# Altium project EMG-Arm_ELC-v1.0.PrjPcb (part 1 of 9)
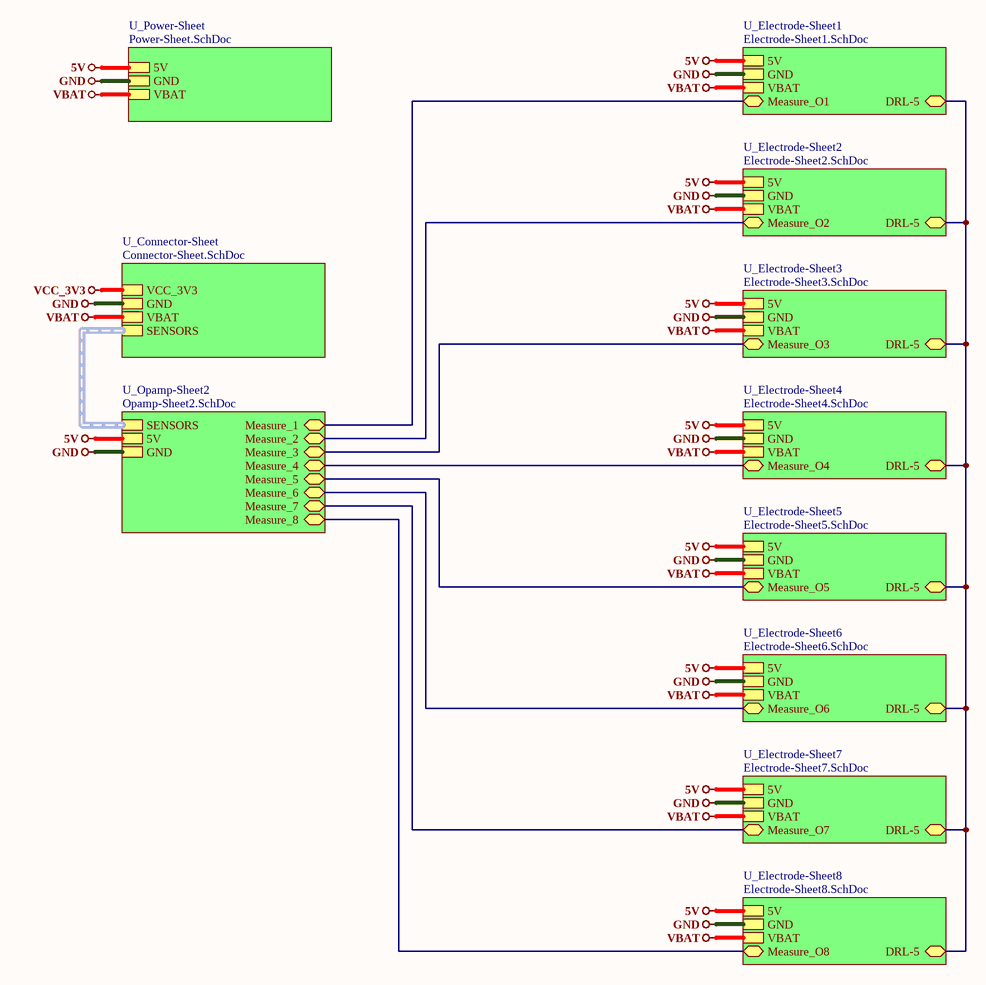
[diagram p0: Top-Sheet.SchDoc]
12 sheets, 303 parts. Net scope: hierarchical (ports join the sheet entries above them; power ports are global).
Board file: EMG-Arm-ELEC-V1.0.PcbDoc
Sheets:
  Top-Sheet.SchDoc
    U_Power-Sheet = Power-Sheet.SchDoc
    U_Opamp-Sheet2 = Opamp-Sheet2.SchDoc
    U_Connector-Sheet = Connector-Sheet.SchDoc
    U_Electrode-Sheet1 = Electrode-Sheet1.SchDoc
    U_Electrode-Sheet2 = Electrode-Sheet2.SchDoc
    U_Electrode-Sheet3 = Electrode-Sheet3.SchDoc
    U_Electrode-Sheet4 = Electrode-Sheet4.SchDoc
    U_Electrode-Sheet5 = Electrode-Sheet5.SchDoc
    U_Electrode-Sheet6 = Electrode-Sheet6.SchDoc
    U_Electrode-Sheet7 = Electrode-Sheet7.SchDoc
    U_Electrode-Sheet8 = Electrode-Sheet8.SchDoc

## Sheet Top-Sheet.SchDoc
size 420 x 297 mm; SheetNumber: 1; SheetTotal: 12

### Sub-sheets
U_Connector-Sheet = Connector-Sheet.SchDoc: SENSORS (harness SENSORS), VCC_3V3, GND, VBAT
U_Electrode-Sheet1 = Electrode-Sheet1.SchDoc: 5V, GND, VBAT, Measure_O1 (bidir), DRL-5 (bidir)
U_Electrode-Sheet2 = Electrode-Sheet2.SchDoc: 5V, GND, VBAT, Measure_O2 (bidir), DRL-5 (bidir)
U_Electrode-Sheet3 = Electrode-Sheet3.SchDoc: 5V, GND, VBAT, DRL-5 (bidir), Measure_O3 (bidir)
U_Electrode-Sheet4 = Electrode-Sheet4.SchDoc: 5V, GND, VBAT, Measure_O4 (bidir), DRL-5 (bidir)
U_Electrode-Sheet5 = Electrode-Sheet5.SchDoc: 5V, GND, VBAT, Measure_O5 (bidir), DRL-5 (bidir)
U_Electrode-Sheet6 = Electrode-Sheet6.SchDoc: 5V, GND, VBAT, DRL-5 (bidir), Measure_O6 (bidir)
U_Electrode-Sheet7 = Electrode-Sheet7.SchDoc: 5V, GND, VBAT, Measure_O7 (bidir), DRL-5 (bidir)
U_Electrode-Sheet8 = Electrode-Sheet8.SchDoc: 5V, GND, VBAT, Measure_O8 (bidir), DRL-5 (bidir)
U_Opamp-Sheet2 = Opamp-Sheet2.SchDoc: SENSORS (harness SENSORS), 5V, GND, Measure_1 (bidir), Measure_2 (bidir), Measure_3 (bidir), Measure_4 (bidir), Measure_5 (bidir), Measure_6 (bidir), Measure_7 (bidir), Measure_8 (bidir)
U_Power-Sheet = Power-Sheet.SchDoc: 5V, GND, VBAT

### Nets
5V: sheet U_Power-Sheet/5V, sheet U_Opamp-Sheet2/5V, sheet U_Electrode-Sheet1/5V, sheet U_Electrode-Sheet2/5V, sheet U_Electrode-Sheet3/5V, sheet U_Electrode-Sheet4/5V, sheet U_Electrode-Sheet5/5V, sheet U_Electrode-Sheet6/5V, sheet U_Electrode-Sheet7/5V, sheet U_Electrode-Sheet8/5V
GND: sheet U_Power-Sheet/GND, sheet U_Opamp-Sheet2/GND, sheet U_Connector-Sheet/GND, sheet U_Electrode-Sheet1/GND, sheet U_Electrode-Sheet2/GND, sheet U_Electrode-Sheet3/GND, sheet U_Electrode-Sheet4/GND, sheet U_Electrode-Sheet5/GND, sheet U_Electrode-Sheet6/GND, sheet U_Electrode-Sheet7/GND, sheet U_Electrode-Sheet8/GND
VBAT: sheet U_Power-Sheet/VBAT, sheet U_Connector-Sheet/VBAT, sheet U_Electrode-Sheet1/VBAT, sheet U_Electrode-Sheet2/VBAT, sheet U_Electrode-Sheet3/VBAT, sheet U_Electrode-Sheet4/VBAT, sheet U_Electrode-Sheet5/VBAT, sheet U_Electrode-Sheet6/VBAT, sheet U_Electrode-Sheet7/VBAT, sheet U_Electrode-Sheet8/VBAT
bpfOUT: sheet U_Opamp-Sheet2/Measure_1, sheet U_Electrode-Sheet1/Measure_O1
bpfOUT_2: sheet U_Opamp-Sheet2/Measure_2, sheet U_Electrode-Sheet2/Measure_O2
bpfOUT_3: sheet U_Opamp-Sheet2/Measure_3, sheet U_Electrode-Sheet3/Measure_O3
bpfOUT_4: sheet U_Opamp-Sheet2/Measure_4, sheet U_Electrode-Sheet4/Measure_O4
bpfOUT_5: sheet U_Opamp-Sheet2/Measure_5, sheet U_Electrode-Sheet5/Measure_O5
bpfOUT_6: sheet U_Opamp-Sheet2/Measure_6, sheet U_Electrode-Sheet6/Measure_O6
bpfOUT_7: sheet U_Opamp-Sheet2/Measure_7, sheet U_Electrode-Sheet7/Measure_O7
bpfOUT_8: sheet U_Opamp-Sheet2/Measure_8, sheet U_Electrode-Sheet8/Measure_O8
DRL-5: sheet U_Electrode-Sheet1/DRL-5, sheet U_Electrode-Sheet2/DRL-5, sheet U_Electrode-Sheet3/DRL-5, sheet U_Electrode-Sheet4/DRL-5, sheet U_Electrode-Sheet5/DRL-5, sheet U_Electrode-Sheet6/DRL-5, sheet U_Electrode-Sheet7/DRL-5, sheet U_Electrode-Sheet8/DRL-5

### Buses and harness runs
harness sheet U_Connector-Sheet/SENSORS = sheet U_Opamp-Sheet2/SENSORS

### Notes on the sheet
- File:
- Title:
- Date:
- Page
- Num:
- Total:
- Drawn By: Huzaifa Ali

## Sheet Power-Sheet.SchDoc
size A4; SheetNumber: 2; SheetTotal: 11
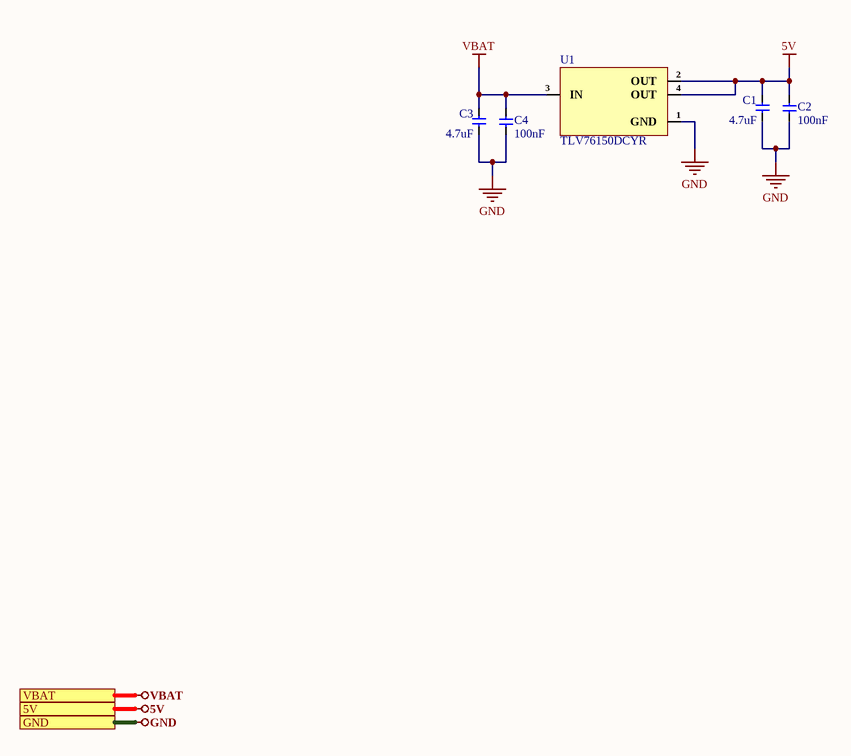
[diagram p1: Power-Sheet.SchDoc]

### Parts
C1  4.7uF  [Cap-0805]
C2  100nF  [cap-0402]
C3  4.7uF  [Cap-0805]
C4  100nF  [cap-0402]
U1  TLV76150DCYR  [SOT- 223]

### Ports
5V (see Top-Sheet[1A], Electrode-Sheet1[3D], Electrode-Sheet2[3D], Electrode-Sheet3[3D], Electrode-Sheet4[3D], Electrode-Sheet5[3D], Electrode-Sheet6[3D], Electrode-Sheet7[3D], Electrode-Sheet8[3D], Opamp-Sheet2[1D]), GND (see Top-Sheet[1A], Connector-Sheet[1D], Electrode-Sheet1[3D], Electrode-Sheet2[3D], Electrode-Sheet3[3D], Electrode-Sheet4[3D], Electrode-Sheet5[3D], Electrode-Sheet6[3D], Electrode-Sheet7[3D], Electrode-Sheet8[3D], Opamp-Sheet2[1D]), VBAT (see Top-Sheet[1A], Connector-Sheet[1D], Electrode-Sheet1[3D], Electrode-Sheet2[3D], Electrode-Sheet3[3D], Electrode-Sheet4[3D], Electrode-Sheet5[3D], Electrode-Sheet6[3D], Electrode-Sheet7[3D], Electrode-Sheet8[3D])

### Nets
5V: C1.1 C2.2 U1.2(OUT) U1.4(OUT) ; port 5V
GND: C1.2 C2.1 C3.2 C4.1 U1.1(GND) ; port GND
VBAT: C3.1 C4.2 U1.3(IN) ; port VBAT

### Notes on the sheet
- File:
- Title:
- Date:
- Page
- Num:
- Total:
- Drawn By: Huzaifa Ali

### Library data of the parts
C1 C3 = CL21B475KAFNNNE: CAP CER 4.7UF 25V X7R 0805; Manufacturer: Samsung; Item Type: Capacitors; Material: 4241ConductorMaterial; Tolerance: 10%; Supplier: Digikey; LCSC Part Number: C98195; Manufacturer Part Number: CL21B475KAFNNNE; RoHS: Yes; Stock: 74766; Pricing: 1=0.4, 10=0.246, 100=0.1664, 1000=0.1216 (USD); Mounting Technology: Surface Mount; Case/Package: 0805; Case Code (Metric): 2012; Case Code (Imperial): 0805; Min Operating Temperature: -55°C; Max Operating Temperature: 125°C; Packaging: Cut Tape; Value: 4.7uF; Voltage Rating: 25V; Voltage Rating (DC): 25V; Series: CL; Length: 0.079inch; Width: 0.049inch; Height: 1.45mm; Thickness: 0.053inch; Lead Free: Lead Free; RoHS Compliant: Yes; ComponentLink1URL: https://datasheet.ciiva.com/25711/cl21b475kafnnne-25711752.pdf?src-supplier=Digikey; ComponentLink1Description: https://datasheet.ciiva.com/25711/cl21b475kafnnne-25711752.pdf?src-supplier=Digikey
C2 C4 = C1005X7R1H104KT000F: CAP CER 0.1UF 50V X7R 0402; Manufacturer: TDK; Tolerance: 10%; Voltage: 25V; Item Type: Capacitor; Supplier 1: Avnet; Manufacturer Part Number: C1005X7R1H104KT000F; RoHS: No; Category: Ceramic Capacitors; Dielectric: X7R; Supplier Part Number 1: C1005X7R1H104KT000F; LCSC Part Number: C361198; ComponentLink1Description: LCSC; ComponentLink1URL: https://www.lcsc.com/product-detail/Multilayer-Ceramic-Capacitors-MLCC-SMD-SMT_TDK-C1005X7R1H104KT000F_C361198.html
U1 = TLV76150DCYR: IC REG LINEAR 5V 1A SOT-223-4; Manufacturer: Texas Instruments; Supplier: Mouser; LCSC Part Number: C5845194; Manufacturer Part Number: TLV76150DCYR; RoHS: No; Item Type: IC; Stock: 32246; Pricing: 1=0.5, 10=0.314, 50=0.314, 100=0.253, 1000=0.231, 10000=0.167 (USD)

## Sheet Opamp-Sheet2.SchDoc
size A4; DocumentNumber: 2; SheetNumber: 11; SheetTotal: 12
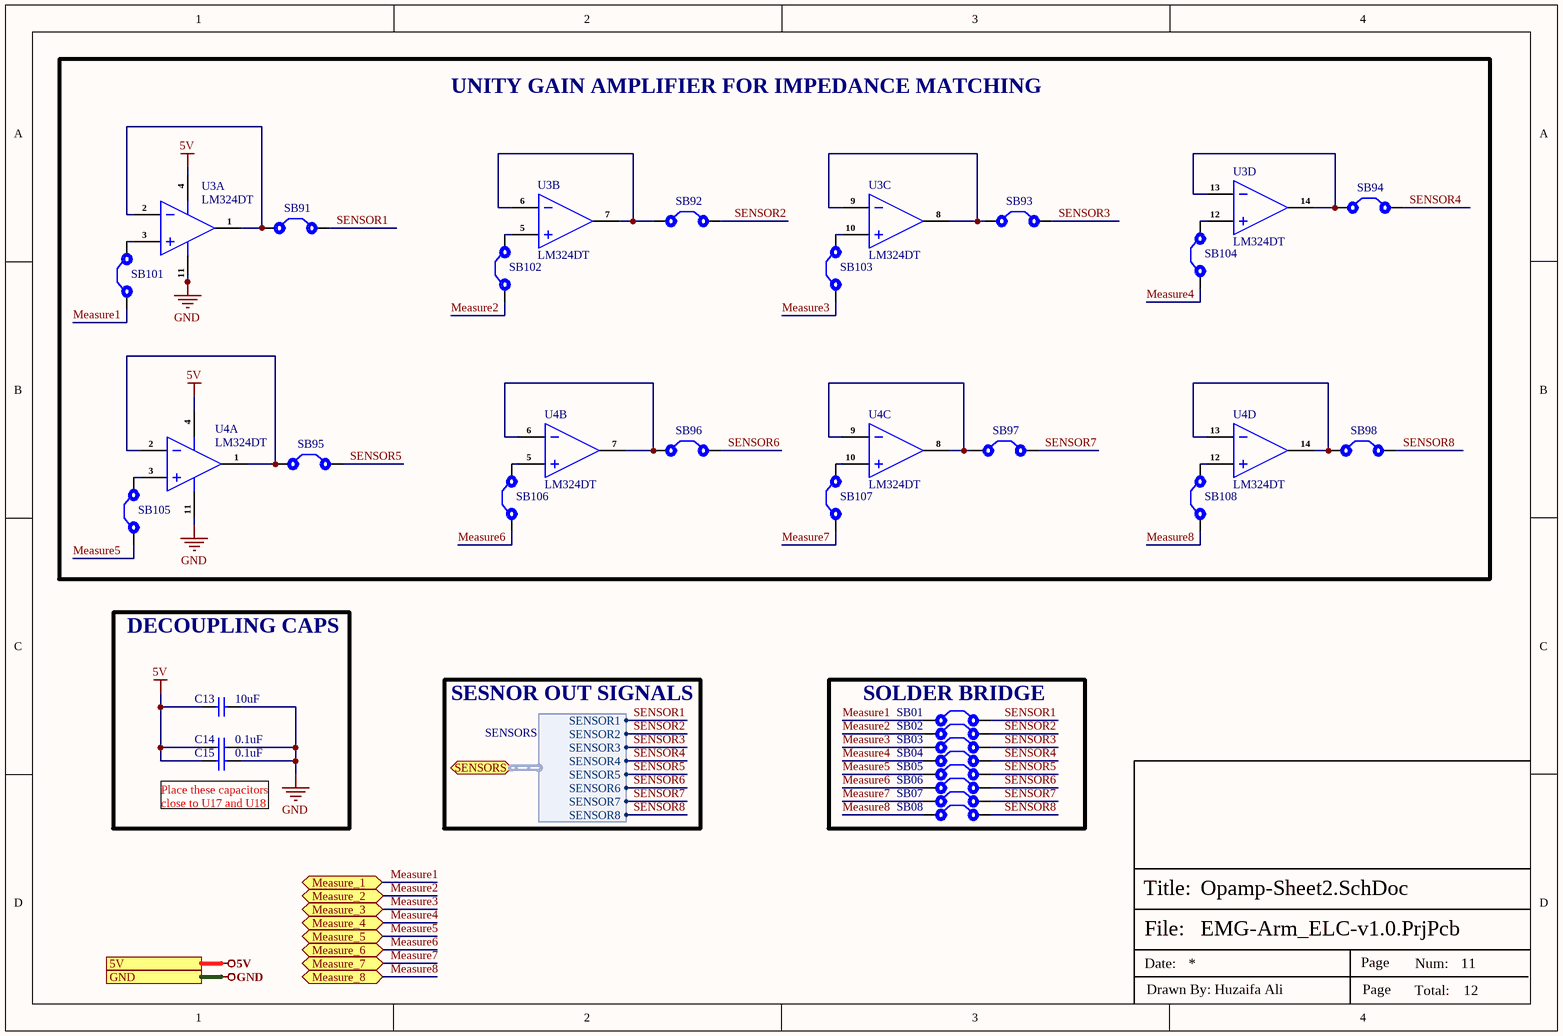
[diagram p2: Opamp-Sheet2.SchDoc]

### Parts
C13  10uF  [Cap-0603]
C14  0.1uF  [Cap-0402]
C15  0.1uF  [Cap-0402]
SB01  Solder Bridge 0402  [Solder Bridge 0402]  (value not drawn)  (no BOM)
SB02  Solder Bridge 0402  [Solder Bridge 0402]  (value not drawn)  (no BOM)
SB03  Solder Bridge 0402  [Solder Bridge 0402]  (value not drawn)  (no BOM)
SB04  Solder Bridge 0402  [Solder Bridge 0402]  (value not drawn)  (no BOM)
SB05  Solder Bridge 0402  [Solder Bridge 0402]  (value not drawn)  (no BOM)
SB06  Solder Bridge 0402  [Solder Bridge 0402]  (value not drawn)  (no BOM)
SB07  Solder Bridge 0402  [Solder Bridge 0402]  (value not drawn)  (no BOM)
SB08  Solder Bridge 0402  [Solder Bridge 0402]  (value not drawn)  (no BOM)
SB91  Solder Bridge 0402  [Solder Bridge 0402]  (value not drawn)  (no BOM)
SB92  Solder Bridge 0402  [Solder Bridge 0402]  (value not drawn)  (no BOM)
SB93  Solder Bridge 0402  [Solder Bridge 0402]  (value not drawn)  (no BOM)
SB94  Solder Bridge 0402  [Solder Bridge 0402]  (value not drawn)  (no BOM)
SB95  Solder Bridge 0402  [Solder Bridge 0402]  (value not drawn)  (no BOM)
SB96  Solder Bridge 0402  [Solder Bridge 0402]  (value not drawn)  (no BOM)
SB97  Solder Bridge 0402  [Solder Bridge 0402]  (value not drawn)  (no BOM)
SB98  Solder Bridge 0402  [Solder Bridge 0402]  (value not drawn)  (no BOM)
SB101  Solder Bridge 0402  [Solder Bridge 0402]  (value not drawn)  (no BOM)
SB102  Solder Bridge 0402  [Solder Bridge 0402]  (value not drawn)  (no BOM)
SB103  Solder Bridge 0402  [Solder Bridge 0402]  (value not drawn)  (no BOM)
SB104  Solder Bridge 0402  [Solder Bridge 0402]  (value not drawn)  (no BOM)
SB105  Solder Bridge 0402  [Solder Bridge 0402]  (value not drawn)  (no BOM)
SB106  Solder Bridge 0402  [Solder Bridge 0402]  (value not drawn)  (no BOM)
SB107  Solder Bridge 0402  [Solder Bridge 0402]  (value not drawn)  (no BOM)
SB108  Solder Bridge 0402  [Solder Bridge 0402]  (value not drawn)  (no BOM)
U3  LM324DT  [14-SO]  (parts A,B,C,D of 4)
U4  LM324DT  [14-SO]  (parts A,B,C,D of 4)

### Blocks framed on the sheet
UNITY GAIN AMPLIFIER FOR IMPEDANCE MATCHING: SB91-SB98 SB101-SB108 U3 U4
DECOUPLING CAPS: C13-C15
SOLDER BRIDGE: SB01 SB02 SB03 SB04 SB05 SB06 SB07 SB08

### Ports
5V (see Top-Sheet[2B], Electrode-Sheet1[3D], Electrode-Sheet2[3D], Electrode-Sheet3[3D], Electrode-Sheet4[3D], Electrode-Sheet5[3D], Electrode-Sheet6[3D], Electrode-Sheet7[3D], Electrode-Sheet8[3D], Power-Sheet[1D]), GND (see Top-Sheet[2B], Connector-Sheet[1D], Electrode-Sheet1[3D], Electrode-Sheet2[3D], Electrode-Sheet3[3D], Electrode-Sheet4[3D], Electrode-Sheet5[3D], Electrode-Sheet6[3D], Electrode-Sheet7[3D], Electrode-Sheet8[3D], Power-Sheet[1D]), Measure_1 (bidir, see Top-Sheet[2B]), Measure_2 (bidir, see Top-Sheet[2B]), Measure_3 (bidir, see Top-Sheet[2B]), Measure_4 (bidir, see Top-Sheet[2B]), Measure_5 (bidir, see Top-Sheet[2C]), Measure_6 (bidir, see Top-Sheet[2C]), Measure_7 (bidir, see Top-Sheet[2C]), Measure_8 (bidir, see Top-Sheet[2C]), SENSORS (bidir, harness SENSORS, see Top-Sheet[2B], Connector-Sheet[3A])

### Harnesses
SENSORS: SENSOR1, SENSOR2, SENSOR3, SENSOR4, SENSOR5, SENSOR6, SENSOR7, SENSOR8

### Nets
5V: C13.1 C14.1 C15.1 U3.4(VCC+) U4.4(VCC+) ; port 5V
GND: C13.2 C14.2 C15.2 U3.11(VCC-) U4.11(VCC-) ; port GND
Measure1: SB01.1 SB101.1 ; port Measure_1  [project net bpfOUT]
Measure2: SB02.1 SB102.1 ; port Measure_2  [project net bpfOUT_2]
Measure3: SB03.1 SB103.1 ; port Measure_3  [project net bpfOUT_3]
Measure4: SB04.1 SB104.1 ; port Measure_4  [project net bpfOUT_4]
Measure5: SB05.1 SB105.1 ; port Measure_5  [project net bpfOUT_5]
Measure6: SB06.1 SB106.1 ; port Measure_6  [project net bpfOUT_6]
Measure7: SB07.1 SB107.1 ; port Measure_7  [project net bpfOUT_7]
Measure8: SB08.1 SB108.1 ; port Measure_8  [project net bpfOUT_8]
SENSOR1: SB01.2 SB91.2 ; port SENSORS.SENSOR1
SENSOR2: SB02.2 SB92.2 ; port SENSORS.SENSOR2
SENSOR3: SB03.2 SB93.2 ; port SENSORS.SENSOR3
SENSOR4: SB04.2 SB94.2 ; port SENSORS.SENSOR4
SENSOR5: SB05.2 SB95.2 ; port SENSORS.SENSOR5
SENSOR6: SB06.2 SB96.2 ; port SENSORS.SENSOR6
SENSOR7: SB07.2 SB97.2 ; port SENSORS.SENSOR7
SENSOR8: SB08.2 SB98.2 ; port SENSORS.SENSOR8
NetSB91_1: SB91.1 U3.1(1OUT) U3.2(IN-)
NetSB92_1: SB92.1 U3.6(2IN-) U3.7(2OUT)
NetSB93_1: SB93.1 U3.8(3OUT) U3.9(3IN-)
NetSB94_1: SB94.1 U3.13(4IN-) U3.14(4OUT)
NetSB95_1: SB95.1 U4.1(1OUT) U4.2(IN-)
NetSB96_1: SB96.1 U4.6(2IN-) U4.7(2OUT)
NetSB97_1: SB97.1 U4.8(3OUT) U4.9(3IN-)
NetSB98_1: SB98.1 U4.13(4IN-) U4.14(4OUT)
NetSB101_2: SB101.2 U3.3(IN+)
NetSB102_2: SB102.2 U3.5(2IN+)
NetSB103_2: SB103.2 U3.10(3IN+)
NetSB104_2: SB104.2 U3.12(4IN+)
NetSB105_2: SB105.2 U4.3(IN+)
NetSB106_2: SB106.2 U4.5(2IN+)
NetSB107_2: SB107.2 U4.10(3IN+)
NetSB108_2: SB108.2 U4.12(4IN+)

### Notes on the sheet
- SESNOR OUT SIGNALS
- Place these capacitors close to U17 and U18
- File:
- Title:
- Date:
- Page
- Num:
- Total:
- Drawn By: Huzaifa Ali

### Library data of the parts
C13 = CL10A106MA8NRNC: CAP CER 10UF 25V X5R 0603; Manufacturer: Samsung; Tolerance: 20%; Supplier 1: Avnet; Manufacturer Part Number: CL10A106MA8NRNC; RoHS: Yes; Category: Ceramic Capacitors; Pricing 1: 4000=0.03753, 8000=0.03700, 16000=0.03595, 24000=0.03515, 32000=0.03383, 40000=0.03304, 400000=0.03225 (USD); Mount: Surface Mount; Case/Package: 0603; Case Code (Metric): 1608; Case Code (Imperial): 0603; Contact Plating: Tin; Min Operating Temperature: -55°C; Max Operating Temperature: 85°C; Package Quantity: 1; Packaging: Tape and Reel; Capacitance: 10uF; Voltage Rating: 25V; Dielectric: X5R; Termination: Wraparound; Series: CL; Construction: Flat; Length: 0.063inch; Width: 0.031inch; Thickness: 0.035inch; Lead Free: Lead Free; RoHS Compliant: Yes; ComponentLink1URL: https://datasheet.ciiva.com/25766/cl10a106ma8nrnc-25766562.pdf?src-supplier=Digi-Key; ComponentLink1Description: https://datasheet.ciiva.com/25766/cl10a106ma8nrnc-25766562.pdf?src-supplier=Digi-Key; Supplier Part Number 1: CL10A106MA8NRNC; LCSC Part Number: C96446
C14 C15 = GRM155R71H104ME14D: CAP CER 0.1UF 50V X7R 0402; Manufacturer: Murata; Tolerance: 20%; Capacitance: 100nF; Item Type: Capacitor; Supplier 1: Avnet; Manufacturer Part Number: GRM155R71H104ME14D; Stock 1: 100000; Pricing 1: 10000=0.00444, 20000=0.00420, 40000=0.00396, 60000=0.00372, 80000=0.00348, 100000=0.00324, 1000000=0.00300 (USD); Mount: Surface Mount; Case/Package: 0402; Min Operating Temperature: -55°C; Max Operating Temperature: 125°C; Packaging: Cut Tape; Voltage Rating: 50V; Length: 0.039inch; Width: 0.02inch; Thickness: 0.022inch; ComponentLink1URL: http://www.mouser.com/ds/2/281/c02e-2905.pdf?src-supplier=Mouser; ComponentLink1Description: http://www.mouser.com/ds/2/281/c02e-2905.pdf?src-supplier=Mouser; ComponentLink2URL: http://search.murata.co.jp/Ceramy/image/img/A01X/G101/ENG/GRM155R71H104ME14-01.pdf?src-supplier=Digi-Key; ComponentLink2Description: http://search.murata.co.jp/Ceramy/image/img/A01X/G101/ENG/GRM155R71H104ME14-01.pdf?src-supplier=Digi-Key; ComponentLink3URL: http://psearch.en.murata.com/capacitor/product/GRM155R71H104ME14%23.pdf?src-supplier=Avnet; ComponentLink3Description: http://psearch.en.murata.com/capacitor/product/GRM155R71H104ME14%23.pdf?src-supplier=Avnet; Supplier Part Number 1: GRM155R71H104ME14D; RoHS: Yes; Category: Ceramic Capacitors; RoHS Compliant: Yes; LCSC Part Number: C182412
SB01 SB02 SB03 SB04 SB05 SB06 SB07 SB08 SB91-SB98 SB101-SB108 = Solder Bridge 0402: Solder Bridge ON; Manufacturer Part Number: Solder Bridge 0402; Item Type: Solder Bridge
U3 U4 = LM324DT: IC OPAMP GP 1.3MHZ 14SO; Manufacturer: STMicroelectronics; Max Supply Voltage: 30V; Min Supply Voltage: 3V; Min Dual Supply Voltage: 1.5V; Max Dual Supply Voltage: 15V; Voltage Gain: 100dB; Slew Rate: 0.4V/µs; Common Mode Rejection Ratio: 70dB; Nominal Supply Current: 1.2mA; Input Offset Voltage (Vos): 7mV; Input Bias Current: 150nA; Number of Circuits: 4; Output Current per Channel: 40mA; Dual Supply Voltage: 12V; Supply Type: Single,Dual; Input Voltage Noise Density: 40nV/sqrt Hz; Max Power Dissipation: 400mW; Supplier 1: Arrow Electronics; Manufacturer Part Number: LM324DT; RoHS: Yes; Stock 1: 287500; Pricing 1: 2500=0.18900 (USD); Mount: Surface Mount; Case/Package: SO; Number of Pins: 14; Contact Plating: Tin,Matte; Weight: 0.009143oz; Min Operating Temperature: 0°C; Max Operating Temperature: 70°C; Gain Bandwidth Product: 1.3MHz; Packaging: Cut Tape; Package Quantity: 2500; Operating Supply Current: 1.2mA; Operating Supply Voltage: 15V; Number of Channels: 4; Output Current: 40mA; Number of Elements: 4; Series: LM324; Technology: BIPOLAR; Bandwidth: 1.3MHz; Number of Amplifiers: 4; Unity Gain Bandwidth Product: 1.3MHz; Width: 4mm; Height: 1.65mm; Radiation Hardening: No; RoHS Compliant: Yes; Lead Free: Lead Free; REACH SVHC: No SVHC; ComponentLink1URL: https://datasheet.ciiva.com/4758/cd00000457-103203-4758032.pdf?src-supplier=Mouser; ComponentLink1Description: https://datasheet.ciiva.com/4758/cd00000457-103203-4758032.pdf?src-supplier=Mouser; ComponentLink2URL: https://datasheet.ciiva.com/8008/1834360-8008827.pdf?src-supplier=Element14; ComponentLink2Description: https://datasheet.ciiva.com/8008/1834360-8008827.pdf?src-supplier=Element14; ComponentLink3URL: https://datasheet.ciiva.com/8008/1834360-8008490.pdf?src-supplier=Element14; ComponentLink3Description: https://datasheet.ciiva.com/8008/1834360-8008490.pdf?src-supplier=Element14; ComponentLink4URL: https://datasheet.ciiva.com/28630/1834360-28630538.pdf?src-supplier=Element14; ComponentLink4Description: https://datasheet.ciiva.com/28630/1834360-28630538.pdf?src-supplier=Element14; ComponentLink5URL: https://datasheet.ciiva.com/1795/cd00000457-1795560.pdf?src-supplier=Digi-Key; ComponentLink5Description: https://datasheet.ciiva.com/1795/cd00000457-1795560.pdf?src-supplier=Digi-Key; ComponentLink6URL: https://datasheet.ciiva.com/1795/cd00000457-1795559.pdf?src-supplier=Digi-Key; ComponentLink6Description: https://datasheet.ciiva.com/1795/cd00000457-1795559.pdf?src-supplier=Digi-Key; ComponentLink7URL: https://datasheet.ciiva.com/1795/cd00000457-1795561.pdf?src-supplier=Digi-Key; ComponentLink7Description: https://datasheet.ciiva.com/1795/cd00000457-1795561.pdf?src-supplier=Digi-Key; ComponentLink8URL: https://datasheet.ciiva.com/16375/cd00000457-16375528.pdf?src-supplier=Future+Electronics; ComponentLink8Description: https://datasheet.ciiva.com/16375/cd00000457-16375528.pdf?src-supplier=Future+Electronics; Supplier Part Number 1: LM324DT; LCSC Part Number: C71035; Item Type: IC

## Sheet Connector-Sheet.SchDoc
size A4; DocumentNumber: 3; SheetNumber: 12; SheetTotal: 12
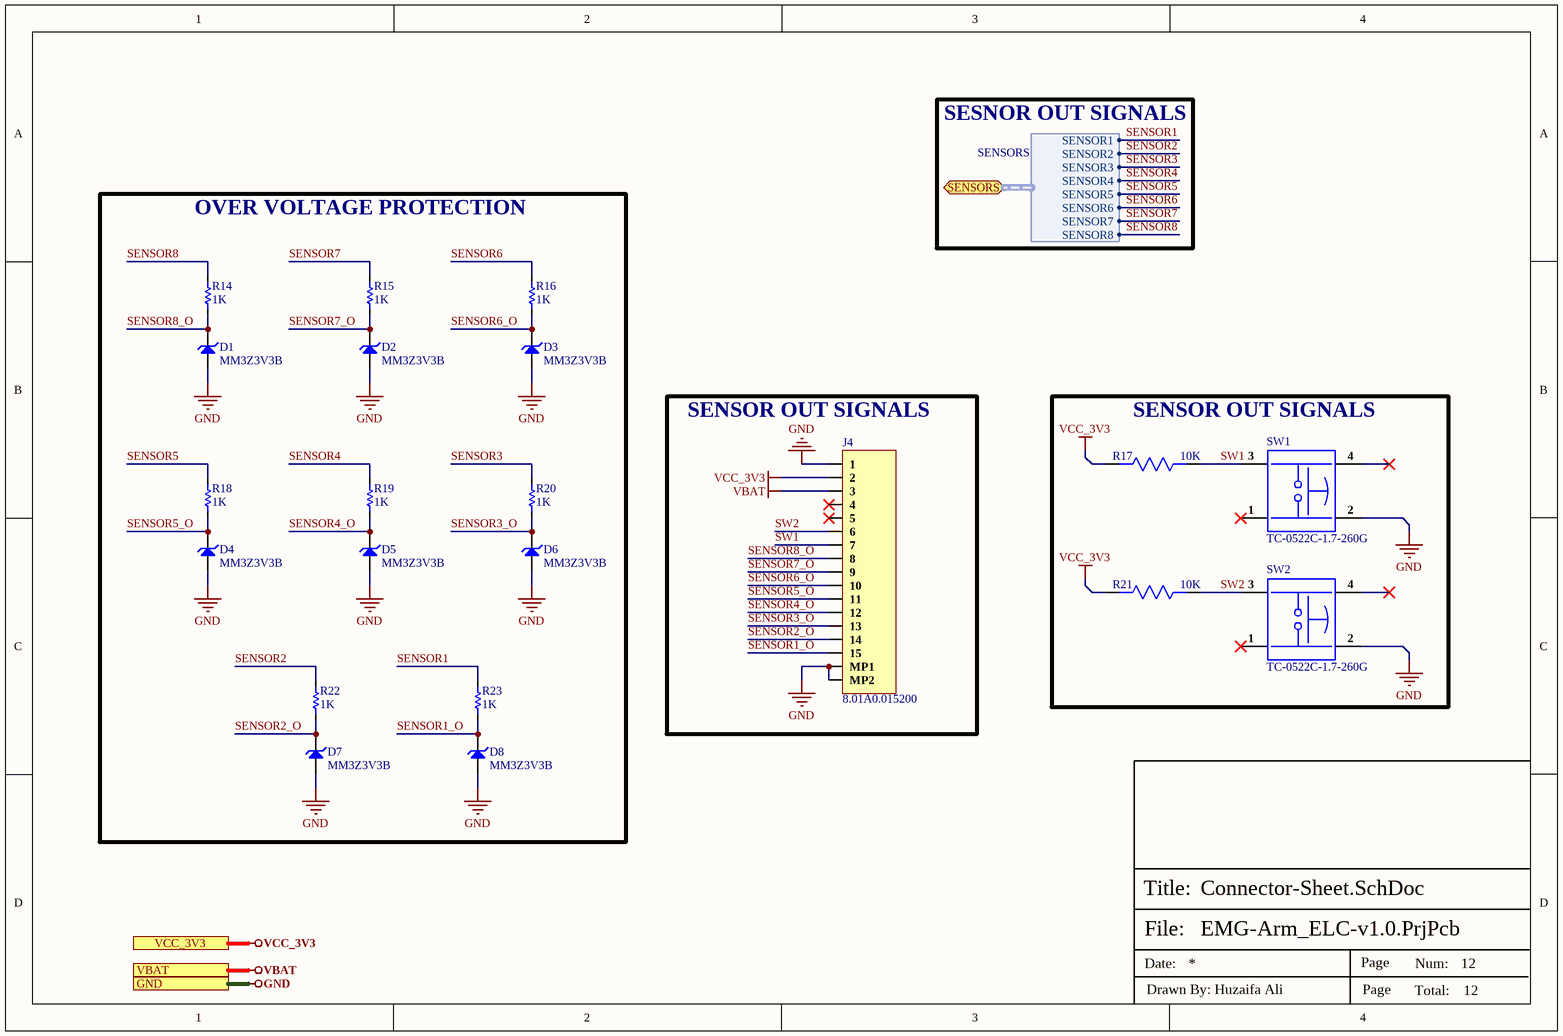
[diagram p3: Connector-Sheet.SchDoc]

### Parts
D1  MM3Z3V3B  [SOD323F]
D2  MM3Z3V3B  [SOD323F]
D3  MM3Z3V3B  [SOD323F]
D4  MM3Z3V3B  [SOD323F]
D5  MM3Z3V3B  [SOD323F]
D6  MM3Z3V3B  [SOD323F]
D7  MM3Z3V3B  [SOD323F]
D8  MM3Z3V3B  [SOD323F]
J4  8.01A0.015200  [8.01A0.015200]
R14  1K  [Res-0402]
R15  1K  [Res-0402]
R16  1K  [Res-0402]
R17  10K  [Res-0402]
R18  1K  [Res-0402]
R19  1K  [Res-0402]
R20  1K  [Res-0402]
R21  10K  [Res-0402]
R22  1K  [Res-0402]
R23  1K  [Res-0402]
SW1  TC-0522C-1.7-260G  [TC-0522C-1.7-260G_]
SW2  TC-0522C-1.7-260G  [TC-0522C-1.7-260G_]

### Blocks framed on the sheet
OVER VOLTAGE PROTECTION: D1-D8 R14-R16 R18-R20 R22 R23
SENSOR OUT SIGNALS: J4
SENSOR OUT SIGNALS: R17 R21 SW1 SW2

### Ports
GND (see Top-Sheet[2B], Electrode-Sheet1[3D], Electrode-Sheet2[3D], Electrode-Sheet3[3D], Electrode-Sheet4[3D], Electrode-Sheet5[3D], Electrode-Sheet6[3D], Electrode-Sheet7[3D], Electrode-Sheet8[3D], Opamp-Sheet2[1D], Power-Sheet[1D]), SENSORS (bidir, harness SENSORS, see Top-Sheet[2B], Opamp-Sheet2[2C]), VBAT (see Top-Sheet[2B], Electrode-Sheet1[3D], Electrode-Sheet2[3D], Electrode-Sheet3[3D], Electrode-Sheet4[3D], Electrode-Sheet5[3D], Electrode-Sheet6[3D], Electrode-Sheet7[3D], Electrode-Sheet8[3D], Power-Sheet[1D]), VCC_3V3 (see Top-Sheet[2B])

### Harnesses
SENSORS: SENSOR1, SENSOR2, SENSOR3, SENSOR4, SENSOR5, SENSOR6, SENSOR7, SENSOR8

### Nets
GND: D1.1(A) D2.1(A) D3.1(A) D4.1(A) D5.1(A) D6.1(A) D7.1(A) D8.1(A) J4.1 J4.MP1 J4.MP2 SW1.2 SW2.2 ; port GND
VBAT: J4.3 ; port VBAT
VCC_3V3: J4.2 R17.2 R21.2 ; port VCC_3V3
SENSOR1: R23.2 ; port SENSORS.SENSOR1
SENSOR1_O: D8.2(K) J4.15 R23.1
SENSOR2: R22.2 ; port SENSORS.SENSOR2
SENSOR2_O: D7.2(K) J4.14 R22.1
SENSOR3: R20.2 ; port SENSORS.SENSOR3
SENSOR3_O: D6.2(K) J4.13 R20.1
SENSOR4: R19.2 ; port SENSORS.SENSOR4
SENSOR4_O: D5.2(K) J4.12 R19.1
SENSOR5: R18.2 ; port SENSORS.SENSOR5
SENSOR5_O: D4.2(K) J4.11 R18.1
SENSOR6: R16.2 ; port SENSORS.SENSOR6
SENSOR6_O: D3.2(K) J4.10 R16.1
SENSOR7: R15.2 ; port SENSORS.SENSOR7
SENSOR7_O: D2.2(K) J4.9 R15.1
SENSOR8: R14.2 ; port SENSORS.SENSOR8
SENSOR8_O: D1.2(K) J4.8 R14.1
SW1: J4.7 R17.1 SW1.3
SW2: J4.6 R21.1 SW2.3

Not connected (* = marked no-connect by the designer): J4 4* 5*; SW1 1* 4*; SW2 1* 4*

### Notes on the sheet
- SESNOR OUT SIGNALS
- File:
- Title:
- Date:
- Page
- Num:
- Total:
- Drawn By: Huzaifa Ali

### Library data of the parts
D1-D8 = MM3Z3V3B: DIODE ZENER 3.3V 200MW SOD323F; Manufacturer: ON Semiconductor / Fairchild; Forward Voltage: 1V; Tolerance: 2%; Impedance: 89R; Max Reverse Leakage Current: 4.5uA; Test Current: 5mA; Element Configuration: Single; Supplier 1: Digi-Key; Manufacturer Part Number: MM3Z3V3B; Stock 1: 473644; Pricing 1: 1=0.22, 10=0.18, 100=0.0956, 500=0.06288, 1000=0.04276 (USD); Mount: Surface Mount; Number of Pins: 2; Weight: 0.0276g; Min Operating Temperature: -65°C; Max Operating Temperature: 150°C; Packaging: Tape and Reel; Package Quantity: 1; Max Power Dissipation: 200mW; Zener Voltage: 3.3V; Voltage Tolerance: 2%; Power Dissipation: 200mW; Working Voltage: 3.3V; Peak Reverse Current: 4.5uA; Length: 1.3mm; Height: 1mm; Width: 1.7mm; Radiation Hardening: No; REACH SVHC: No SVHC; Lead Free: Lead Free; ComponentLink1URL: http://www.onsemi.com/pub/Collateral/MM3Z9V1B-D.pdf?src-supplier=Digi-Key; ComponentLink1Description: http://www.onsemi.com/pub/Collateral/MM3Z9V1B-D.pdf?src-supplier=Digi-Key; ComponentLink2URL: http://www.mouser.com/ds/2/149/MM3Z3V3B-187166.pdf?src-supplier=Mouser; ComponentLink2Description: http://www.mouser.com/ds/2/149/MM3Z3V3B-187166.pdf?src-supplier=Mouser; ComponentLink3URL: https://www.fairchildsemi.com/datasheets/MM/MM3Z9V1B.pdf?src-supplier=Avnet; ComponentLink3Description: https://www.fairchildsemi.com/datasheets/MM/MM3Z9V1B.pdf?src-supplier=Avnet; ComponentLink4URL: http://www.farnell.com/datasheets/1706525.pdf?src-supplier=Element14; ComponentLink4Description: http://www.farnell.com/datasheets/1706525.pdf?src-supplier=Element14; Supplier Part Number 1: MM3Z3V3BCT-ND; LCSC Part Number: C2978865; Item Type: Diode
J4 = 8.01A0.015200: -40℃~+80℃ 15P Dual-sided contacts / top and bottom connection 0.5mm SMD,P=0.5mm,Surface Mount，Right Angle FFC, FPC (Flat Flexible) Connector Assemblies ROHS; Manufacturer: DIANWEI; Item Type: FFC, FPC Connector; Manufacturer Part Number: 8.01A0.015200; Package: SMD,P=0.5mm,Surface Mount，Right Angle; LCSC Part Number: C19188796; ComponentLink1Description: LCSC; ComponentLink1URL: https://www.lcsc.com/product-detail/FFC-FPC-Flat-Flexible-Connector-Assemblies_DIANWEI-8-01A0-015200_C19188796.html?s_z=n_HC-FPC-05-20-15RLTAG
R14-R16 R18-R20 R22 R23 = RC0402FR-071KL: RES 1K OHM 1% 1/16W 0402; Manufacturer: Yageo; Resistance: 1kR; Temperature Coefficient: 100ppm/°C; Voltage Rating (DC): 50V; Power Rating: 62.5mW; Max Power Dissipation: 63mW; Item Type: Resistor; Supplier 1: Avnet; Manufacturer Part Number: RC0402FR-071KL; RoHS: Yes; Category: Chip SMD Resistors; Stock 1: 13030000; Pricing 1: 10000=0.00085, 20000=0.00087, 40000=0.00084, 60000=0.00083, 80000=0.00079, 100000=0.00078, 1000000=0.00076 (USD); Case/Package: 0402; Number of Pins: 2; Case Code (Imperial): 0402; Case Code (Metric): 1005; Size Code: 0402; Min Operating Temperature: -55°C; Max Operating Temperature: 155°C; Resistor Type: Thick Film; Tolerance: 1%; Packaging: Tape and Reel; Voltage Rating: 50V; Termination: SMD/SMT; Features: Moisture Resistant; Series: RC; Number of Terminations: 2; Resistance Tolerance: 1%; Construction: Rectangular; Technology: THICK FILM; Length: 1mm; Width: 0.5mm; Height: 0.32mm; Depth: 0.5mm; Reach SVHC Compliant: Yes; Lead Free: Lead Free; RoHS Compliant: Yes; Military Standard: Not; ComponentLink1URL: https://datasheet.ciiva.com/11819/0900766b80c66297-11819477.pdf?src-supplier=RSComponents; ComponentLink1Description: https://datasheet.ciiva.com/11819/0900766b80c66297-11819477.pdf?src-supplier=RSComponents; ComponentLink2URL: https://datasheet.ciiva.com/7983/1018594-7983502.pdf?src-supplier=Element14; ComponentLink2Description: https://datasheet.ciiva.com/7983/1018594-7983502.pdf?src-supplier=Element14; ComponentLink3URL: https://datasheet.ciiva.com/22747/1018594-22747513.pdf?src-supplier=Element14; ComponentLink3Description: https://datasheet.ciiva.com/22747/1018594-22747513.pdf?src-supplier=Element14; ComponentLink4URL: https://datasheet.ciiva.com/12666/pyu-rc0402-51-rohs-l-6-r-12666741.pdf?src-supplier=Mouser; ComponentLink4Description: https://datasheet.ciiva.com/12666/pyu-rc0402-51-rohs-l-6-r-12666741.pdf?src-supplier=Mouser; ComponentLink5URL: https://datasheet.ciiva.com/7849/1018594-7849869.pdf?src-supplier=Element14; ComponentLink5Description: https://datasheet.ciiva.com/7849/1018594-7849869.pdf?src-supplier=Element14; ComponentLink6URL: https://datasheet.ciiva.com/7849/1018594-7849871.pdf?src-supplier=Element14; ComponentLink6Description: https://datasheet.ciiva.com/7849/1018594-7849871.pdf?src-supplier=Element14; ComponentLink7URL: https://datasheet.ciiva.com/17063/pyu-rc0402-51-rohs-l-6-r-17063193.pdf?src-supplier=Future+Electronics; ComponentLink7Description: https://datasheet.ciiva.com/17063/pyu-rc0402-51-rohs-l-6-r-17063193.pdf?src-supplier=Future+Electronics; Supplier Part Number 1: RC0402FR-071KL; LCSC Part Number: C106235
R17 R21 = RC0402FR-0710KL: RES 10K OHM 1% 1/16W 0402; Manufacturer: Yageo; Resistance: 10kR; Temperature Coefficient: 100ppm/°C; Voltage Rating (DC): 50V; Power Rating: 62.5mW; Max Power Dissipation: 63mW; Supplier 1: Mouser; Manufacturer Part Number: RC0402FR-0710KL; Stock 1: 18648329; Pricing 1: 1=0.10000, 10=0.01400, 50=0.01400, 100=0.00500, 1000=0.00300, 10000=0.00200 (USD); Case/Package: 0402; Number of Pins: 2; Case Code (Imperial): 0402; Case Code (Metric): 1005; Min Operating Temperature: -55°C; Max Operating Temperature: 155°C; Tolerance: 1%; Packaging: Tape and Reel; Voltage Rating: 50V; Termination: SMD/SMT; Military Standard: Not; Working Voltage: 50V; Number of Terminations: 2; Length: 1mm; Height: 0.32mm; Width: 0.5mm; Depth: 0.5mm; Lead Pitch: 0.2mm; REACH SVHC: No SVHC; Lead Free: Lead Free; ComponentLink1URL: https://datasheet.ciiva.com/7660/38568-7660787.pdf?src-supplier=Element14; ComponentLink1Description: https://datasheet.ciiva.com/7660/38568-7660787.pdf?src-supplier=Element14; ComponentLink2URL: https://datasheet.ciiva.com/7849/1686128-7849814.pdf?src-supplier=Element14; ComponentLink2Description: https://datasheet.ciiva.com/7849/1686128-7849814.pdf?src-supplier=Element14; ComponentLink3URL: https://datasheet.ciiva.com/7983/1018594-7983486.pdf?src-supplier=Element14; ComponentLink3Description: https://datasheet.ciiva.com/7983/1018594-7983486.pdf?src-supplier=Element14; ComponentLink4URL: https://datasheet.ciiva.com/22747/1018594-22747512.pdf?src-supplier=Element14; ComponentLink4Description: https://datasheet.ciiva.com/22747/1018594-22747512.pdf?src-supplier=Element14; Supplier Part Number 1: 603-RC0402FR-0710KL; RoHS: Yes; Category: Chip SMD Resistors; Resistor Type: Thick Film; Features: Moisture Resistant; Series: RC; Resistance Tolerance: 1%; Construction: Rectangular; RoHS Compliant: Yes; ComponentLink5URL: https://datasheet.ciiva.com/12667/pyu-rc0402-51-rohs-l-6-r-12667067.pdf?src-supplier=Mouser; ComponentLink5Description: https://datasheet.ciiva.com/12667/pyu-rc0402-51-rohs-l-6-r-12667067.pdf?src-supplier=Mouser; ComponentLink6URL: https://datasheet.ciiva.com/7849/1784430-7849813.pdf?src-supplier=Element14; ComponentLink6Description: https://datasheet.ciiva.com/7849/1784430-7849813.pdf?src-supplier=Element14; ComponentLink7URL: https://datasheet.ciiva.com/7849/1784430-7849815.pdf?src-supplier=Element14; ComponentLink7Description: https://datasheet.ciiva.com/7849/1784430-7849815.pdf?src-supplier=Element14; LCSC Part Number: C60490
SW1 SW2 = TC-0522C-1.7-260G: No Gull Wing 50mA 100MΩ 80000 260gf@±50gf 12V -25℃~+85℃ 1.7mm Golden Round Button Brick nogging SPST SMD Tactile Switches ROHS; Manufacturer: HCTL; Item Type: Switch; Manufacturer Part Number: TC-0522C-1.7-260G; Value: -; Footprint: Custom; ComponentLink1Description: LCSC; ComponentLink1URL: https://www.lcsc.com/product-detail/Tactile-Switches_HCTL-TC-0522C-1-7-260G_C2845290.html; LCSC Part Number: C2845290